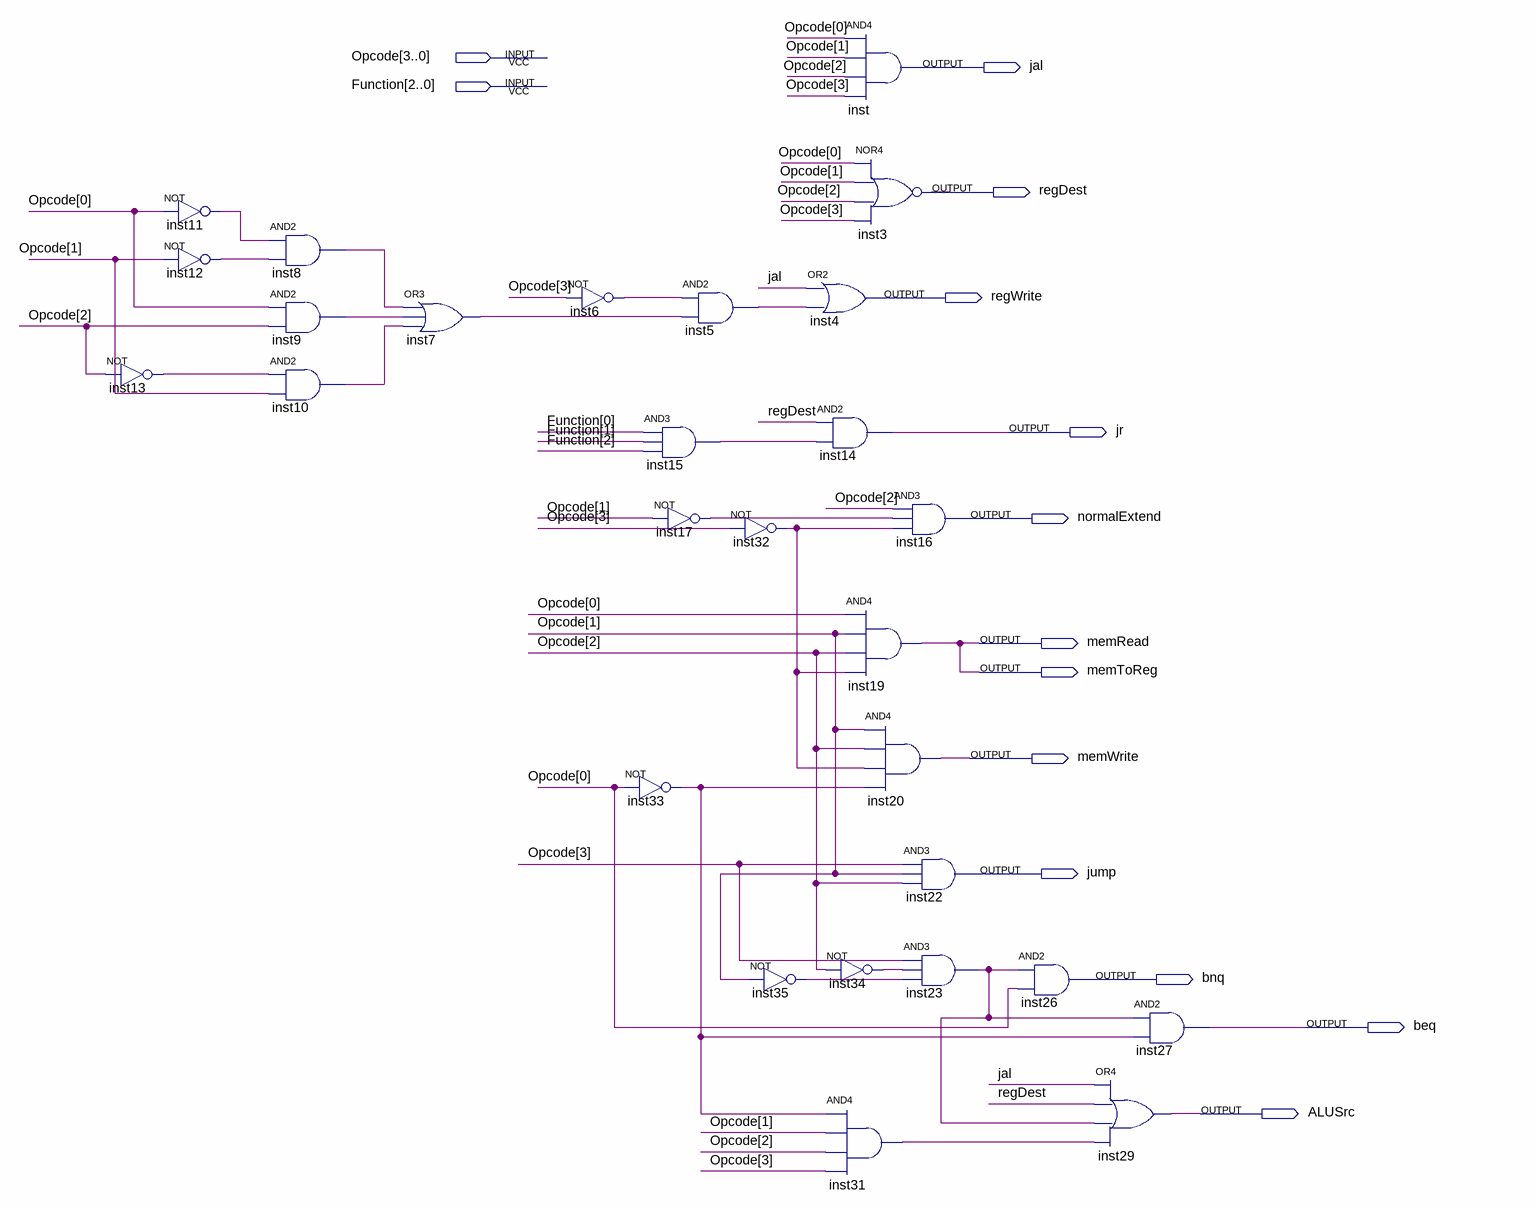
[diagram p0: schematic sheet]
// Quartus schematic ControlUnit.bdf as structural Verilog: 28 symbols, 14 pins
module ControlUnit (
  input  [3:0] Opcode,
  input  [2:0] Function,
  output jal,
  output regDest,
  output regWrite,
  output jr,
  output normalExtend,
  output memRead,
  output memToReg,
  output memWrite,
  output jump,
  output bnq,
  output beq,
  output ALUSrc
);

  wire inst5_out, inst6_out, inst7_out, inst8_out, inst9_out, inst10_out, inst11_out, inst12_out, inst13_out,
       inst15_out, inst17_out, inst23_out, inst31_out, inst32_out, inst33_out, inst34_out, inst35_out;

  not inst13 (inst13_out, Opcode[2]);
  not inst11 (inst11_out, Opcode[0]);
  not inst12 (inst12_out, Opcode[1]);
  and inst8 (inst8_out, inst11_out, inst12_out);
  and inst9 (inst9_out, Opcode[0], Opcode[2]);
  and inst10 (inst10_out, inst13_out, Opcode[1]);
  or inst7 (inst7_out, inst8_out, inst9_out, inst10_out);
  not inst6 (inst6_out, Opcode[3]);
  and inst5 (inst5_out, inst6_out, inst7_out);
  and inst15 (inst15_out, Function[0], Function[1], Function[2]);
  not inst17 (inst17_out, Opcode[1]);
  not inst33 (inst33_out, Opcode[0]);
  not inst32 (inst32_out, Opcode[3]);
  not inst35 (inst35_out, Opcode[1]);
  and inst (jal, Opcode[0], Opcode[1], Opcode[2], Opcode[3]);
  or inst4 (regWrite, jal, inst5_out);
  and inst14 (jr, regDest, inst15_out);
  and inst19 (memRead, Opcode[0], Opcode[1], Opcode[2], inst32_out);
  not inst34 (inst34_out, Opcode[2]);
  and inst31 (inst31_out, inst33_out, Opcode[1], Opcode[2], Opcode[3]);
  nor inst3 (regDest, Opcode[0], Opcode[1], Opcode[2], Opcode[3]);
  and inst16 (normalExtend, Opcode[2], inst17_out, inst32_out);
  and inst20 (memWrite, Opcode[1], Opcode[2], inst32_out, inst33_out);
  and inst22 (jump, Opcode[3], Opcode[1], Opcode[2]);
  and inst23 (inst23_out, Opcode[3], inst34_out, inst35_out);
  and inst26 (bnq, inst23_out, Opcode[0]);
  and inst27 (beq, inst23_out, inst33_out);
  or inst29 (ALUSrc, jal, regDest, inst23_out, inst31_out);

  assign memToReg = memRead;
endmodule
